# Altium schematic sheet Power_Input.SchDoc
size A; DocumentNumber: 1; SheetNumber: 2; SheetTotal: 14
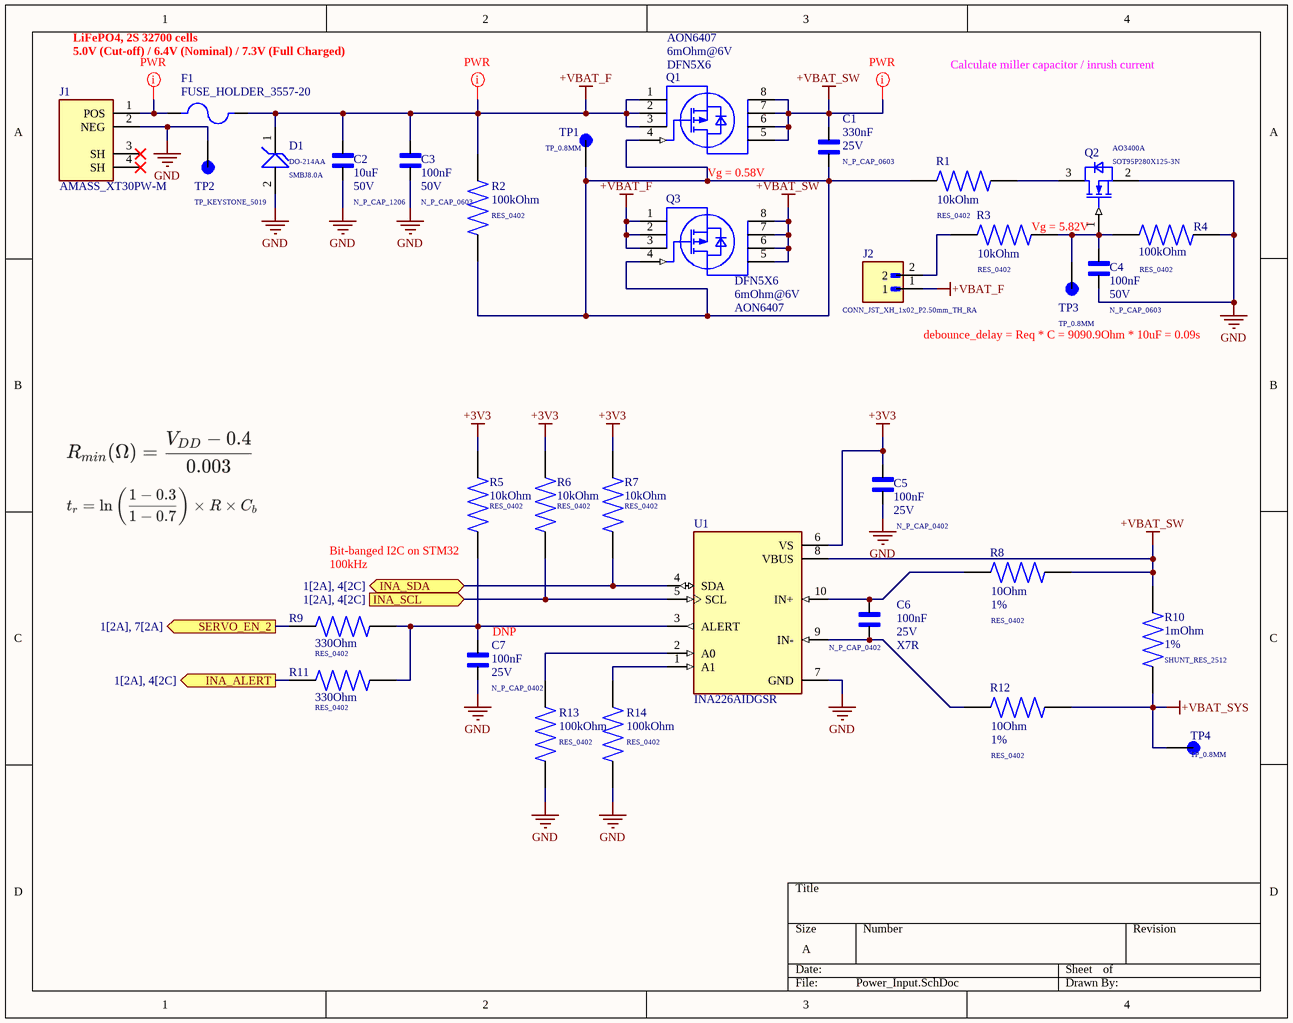
[diagram p0: Power_Input.SchDoc]

## Parts
C1  N_P_CAP_0603  value 330nF  Rated Voltage: 25V  [N_P_CAP_0603]
C2  N_P_CAP_1206  value 10uF  Rated Voltage: 50V  [N_P_CAP_1206]
C3  N_P_CAP_0603  value 100nF  Rated Voltage: 50V  [N_P_CAP_0603]
C4  N_P_CAP_0603  value 100nF  Rated Voltage: 50V  [N_P_CAP_0603]
C5  N_P_CAP_0402  value 100nF  Rated Voltage: 25V  [N_P_CAP_0402]
C6  N_P_CAP_0402  value 100nF  Temperature Coefficient: X7R  Rated Voltage: 25V  [N_P_CAP_0402]
C7  N_P_CAP_0402  value 100nF  Rated Voltage: 25V  [N_P_CAP_0402]
D1  DO-214AA  MPN: SMBJ8.0A  [DO-214AA]
F1  FUSE_HOLDER_3557-20  [FUSE_HOLDER_3557-20]
J1  AMASS_XT30PW-M  [AMASS_XT30PW-M]
J2  CONN_JST_XH_1x02_P2.50mm_TH_RA  [CONN_JST_XH_1x02_P2.50mm_TH_RA]
Q1  DFN5X6  Rds(on) (Max): 6mOhm@6V  MPN: AON6407  [DFN5X6]
Q2  SOT95P280X125-3N  MPN: AO3400A  [SOT95P280X125-3N]
Q3  DFN5X6  Rds(on) (Max): 6mOhm@6V  MPN: AON6407  [DFN5X6]
R1  RES_0402  value 10kOhm  [RES_0402]
R2  RES_0402  value 100kOhm  [RES_0402]
R3  RES_0402  value 10kOhm  [RES_0402]
R4  RES_0402  value 100kOhm  [RES_0402]
R5  RES_0402  value 10kOhm  [RES_0402]
R6  RES_0402  value 10kOhm  [RES_0402]
R7  RES_0402  value 10kOhm  [RES_0402]
R8  RES_0402  value 10Ohm  Tolerance: 1%  [RES_0402]
R9  RES_0402  value 330Ohm  [RES_0402]
R10  SHUNT_RES_2512  value 1mOhm  Tolerance: 1%  [SHUNT_RES_2512]
R11  RES_0402  value 330Ohm  [RES_0402]
R12  RES_0402  value 10Ohm  Tolerance: 1%  [RES_0402]
R13  RES_0402  value 100kOhm  [RES_0402]
R14  RES_0402  value 100kOhm  [RES_0402]
TP1  TP_0.8MM  [TP_0.8MM]
TP2  TP_KEYSTONE_5019  [TP_KEYSTONE_5019]
TP3  TP_0.8MM  [TP_0.8MM]
TP4  TP_0.8MM  [TP_0.8MM]
U1  INA226AIDGSR  [SOP50P490X110-10N]

## Ports
INA_ALERT (out, see 1[2A], 4[2C]), INA_SCL (in, see 1[2A], 4[2C]), INA_SDA (bidir, see 1[2A], 4[2C]), SERVO_EN_2 (out, see 1[2A], 7[2A])

## Nets
+3V3: C5.2 R5.2 R6.2 R7.2 U1.6(VS)
+VBAT_F: C2.2 C3.2 D1.1(K) F1.2 J2.1 Q1.1(SOURCE) Q1.2(SOURCE) Q1.3(SOURCE) Q3.1(SOURCE) Q3.2(SOURCE) Q3.3(SOURCE) R2.1
+VBAT_SW: C1.2 Q1.5(DRAIN) Q1.6(DRAIN) Q1.7(DRAIN) Q1.8(DRAIN) Q3.5(DRAIN) Q3.6(DRAIN) Q3.7(DRAIN) Q3.8(DRAIN) R8.2 R10.2 U1.8(VBUS)
+VBAT_SYS: R10.1 R12.2 TP4.TP
GND: C2.1 C3.1 C4.1 C5.1 C7.1 D1.2(A) J1.2(NEG) Q2.2(SOURCE) R4.2 R13.2 R14.2 TP2.TP U1.7(GND)
INA_ALERT: R11.2 ; port INA_ALERT
INA_SCL: R6.1 U1.5(SCL) ; port INA_SCL
INA_SDA: R7.1 U1.4(SDA) ; port INA_SDA
SERVO_EN_2: R9.1 ; port SERVO_EN_2
NetC1_1: C1.1 Q1.4(GATE) Q3.4(GATE) R1.1 R2.2 TP1.TP
NetC4_2: C4.2 Q2.1(GATE) R3.2 R4.1 TP3.TP
NetC6_1: C6.1 R12.1 U1.9(IN-)
NetC6_2: C6.2 R8.1 U1.10(IN+)
NetC7_2: C7.2 R5.1 R9.2 R11.1 U1.3(ALERT)
NetF1_1: F1.1 J1.1(POS)
NetJ2_2: J2.2 R3.1
NetQ2_3: Q2.3(DRAIN) R1.2
NetR13_1: R13.1 U1.2(A0)
NetR14_1: R14.1 U1.1(A1)

Not connected (* = marked no-connect by the designer): J1 3(SH)* 4(SH)*

## Layout directives
net class PWR: +VBAT_F, +VBAT_SW, NetF1_1

## Notes on the sheet
- LiFePO4, 2S 32700 cells
- 5.0V (Cut-off) / 6.4V (Nominal) / 7.3V (Full Charged)
- Calculate miller capacitor / inrush current
- Vg = 0.58V
- (near R3) Vg = 5.82V
- debounce_delay = Req * C = 9090.9Ohm * 10uF = 0.09s
- (near R5) Bit-banged I2C on STM32
- 100kHz
- (near C7) DNP

## Library data of the parts
C1-C4 C6 = N_P_CAP: GENERIC NON-POLARIZED CAP; Tolerance: *; MF: *; ESR: *; MPN: *
  C1: LCSC Part Number: C107070; Temperature Coefficient: *
  C2: LCSC Part Number: C100122; Temperature Coefficient: *
  C3 C4: LCSC Part Number: C106221; Temperature Coefficient: *
  C6: LCSC Part Number: C105883
C5 C7 = N_P_CAP: GENERIC NON-POLARIZED CAP; Temperature Coefficient: X7R; LCSC Part Number: C105883; Tolerance: *; MF: *; ESR: *; MPN: *
D1 = TVS_DIODE_UNIDIRECTIONAL: GENERIC TVS DIODE UNIDIRECTIONAL; Polarity: Unidirectional; LCSC Part Number: C224028; Ipp (Max): *; Vc (Max): *; Vrwm: *; Vbr: *; MF: *; Direction Type: Unidirectional
F1 = FUSE: GENERIC FUSE; Rated Current: *; Rated Voltage: *; LCSC Part Number: C3205238; Response Time: *; Breaking Capacity: *; Fuse Type: *; MF: *; MPN: *
J1 = AMASS_PCB_CONNECTOR: GENERIC AMASS PCB CONNECTOR; MF: Amass; LCSC Part Number: C431092; MPN: *
J2 = CONN_2P: GENERIC CONNECTOR 2P; MF: *; MPN: *; LCSC Part Number: *
Q1 Q3 = PMOS_SOIC8: GENERIC P-MOSFET SOIC8; Vgs(th): 2.6V; Channel Type: P-Channel; LCSC Part Number: C13899; Vds (Max): *; Id (Max): *; MF: *
Q2 = NMOS_GSD: GENERIC N-MOSFET 1=G, 2=S, 3=D; Channel Type: P-Channel; LCSC Part Number: C20917; Vds (Max): *; Id (Max): *; Vgs(th): *; MF: *; Rds(on) (Max): *
R1-R7 R13 R14 = RES: GENERIC RES; Tolerance: 1%; Power Rating: *; MPN: *; Rated Voltage: *; Temperature Coefficient: *
  R1 R3 R5-R7: LCSC Part Number: C60490
  R2 R4 R13 R14: LCSC Part Number: C60491
R8 R12 = RES: GENERIC RES; Power Rating: *; MPN: *; Rated Voltage: *; Temperature Coefficient: *; LCSC Part Number: C5455560
R9 R11 = RES: GENERIC RES; MPN: RC0402FR-07330RL; Tolerance: 1%; Power Rating: *; Rated Voltage: *; Temperature Coefficient: *; LCSC Part Number: C105875
R10 = SHUNT_RES: GENERIC SHUNT RES; MPN: EB25R001P6FGT; Power Rating: 6W; Rated Voltage: *; Temperature Coefficient: *; LCSC Part Number: C55591707
TP1-TP4 = TEST_POINT: GENERIC TEST POINT; MF: *; MPN: *
U1 = INA226AIDGSR: 36V, 16-bit, ultra-precise i2c output current/voltage/power monitor w/alert; MF: Texas Instruments; Package: VSSOP-10 Texas Instruments; MPN: INA226AIDGSR; LCSC Part Number: C49851